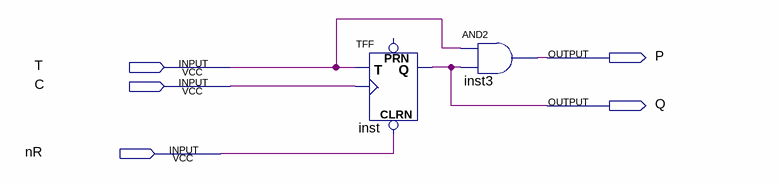
[diagram p0: schematic sheet]
// Quartus schematic counterEB.bdf as structural Verilog: 2 symbols, 5 pins
module counterEB (
  input  T,
  input  C,
  input  nR,
  output P,
  output Q
);

  TFF inst (.CLRN(nR), .T(T), .CLK(C), .Q(Q));  // open: PRN
  and inst3 (P, T, Q);
endmodule
